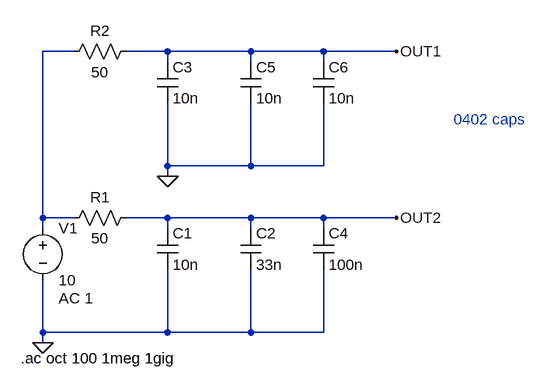
[diagram p0: schematic capacitors_antiresonance.asc]
capacitors_antiresonance.asc, the LTspice schematic file:
Version 4
SHEET 1 880 680
WIRE -48 -128 -96 -128
WIRE 96 -128 32 -128
WIRE 224 -128 96 -128
WIRE 336 -128 224 -128
WIRE 448 -128 336 -128
WIRE 96 -112 96 -128
WIRE 224 -112 224 -128
WIRE 336 -112 336 -128
WIRE 96 48 96 -48
WIRE 224 48 224 -48
WIRE 224 48 96 48
WIRE 336 48 336 -48
WIRE 336 48 224 48
WIRE 96 64 96 48
WIRE -96 128 -96 -128
WIRE -48 128 -96 128
WIRE 96 128 32 128
WIRE 224 128 96 128
WIRE 336 128 224 128
WIRE 448 128 336 128
WIRE -96 144 -96 128
WIRE 96 144 96 128
WIRE 224 144 224 128
WIRE 336 144 336 128
WIRE -96 304 -96 224
WIRE 96 304 96 208
WIRE 96 304 -96 304
WIRE 224 304 224 208
WIRE 224 304 96 304
WIRE 336 304 336 208
WIRE 336 304 224 304
WIRE -96 320 -96 304
FLAG -96 320 0
FLAG 448 128 OUT2
FLAG 448 -128 OUT1
FLAG 96 64 0
SYMBOL cap 80 144 R0
SYMATTR InstName C1
SYMATTR Value 10n
SYMATTR SpiceLine V=50 Irms=247m Rser=60m Lser=253p
SYMBOL cap 208 144 R0
SYMATTR InstName C2
SYMATTR Value 33n
SYMATTR SpiceLine V=50 Irms=940m Rser=40m Lser=307p
SYMBOL voltage -96 128 R0
WINDOW 123 24 124 Left 2
WINDOW 39 24 152 Left 2
SYMATTR InstName V1
SYMATTR Value 10
SYMATTR Value2 AC 1
SYMBOL res 48 112 R90
WINDOW 0 0 56 VBottom 2
WINDOW 3 32 56 VTop 2
SYMATTR InstName R1
SYMATTR Value 50
SYMBOL cap 80 -112 R0
SYMATTR InstName C3
SYMATTR Value 10n
SYMATTR SpiceLine V=200 Irms=247m Rser=60m Lser=253p
SYMBOL res 48 -144 R90
WINDOW 0 0 56 VBottom 2
WINDOW 3 32 56 VTop 2
SYMATTR InstName R2
SYMATTR Value 50
SYMBOL cap 208 -112 R0
SYMATTR InstName C5
SYMATTR Value 10n
SYMATTR SpiceLine V=200 Irms=247m Rser=60m Lser=253p
SYMBOL cap 320 144 R0
SYMATTR InstName C4
SYMATTR Value 100n
SYMATTR SpiceLine V=50 Irms=940m Rser=20m Lser=263p
SYMBOL cap 320 -112 R0
SYMATTR InstName C6
SYMATTR Value 10n
SYMATTR SpiceLine V=200 Irms=247m Rser=60m Lser=253p
TEXT -130 344 Left 2 !.ac oct 100 1meg 1gig
TEXT 536 -24 Left 2 ;0402 caps

The netlist it stands for:
* capacitors_antiresonance.asc
C1 OUT2 0 10n V=50 Irms=247m Rser=60m Lser=253p
C2 OUT2 0 33n V=50 Irms=940m Rser=40m Lser=307p
V1 N001 0 10 AC 1
R1 OUT2 N001 50
C3 OUT1 0 10n V=200 Irms=247m Rser=60m Lser=253p
R2 OUT1 N001 50
C5 OUT1 0 10n V=200 Irms=247m Rser=60m Lser=253p
C4 OUT2 0 100n V=50 Irms=940m Rser=20m Lser=263p
C6 OUT1 0 10n V=200 Irms=247m Rser=60m Lser=253p
.ac oct 100 1meg 1gig
* 0402 caps
.backanno
.end